# Altium schematic sheet PiggySat-radio.SchDoc: PiggySat-radio
size A4; DocumentNumber: 002; Revision: 1.0; SheetNumber: 1; SheetTotal: 2
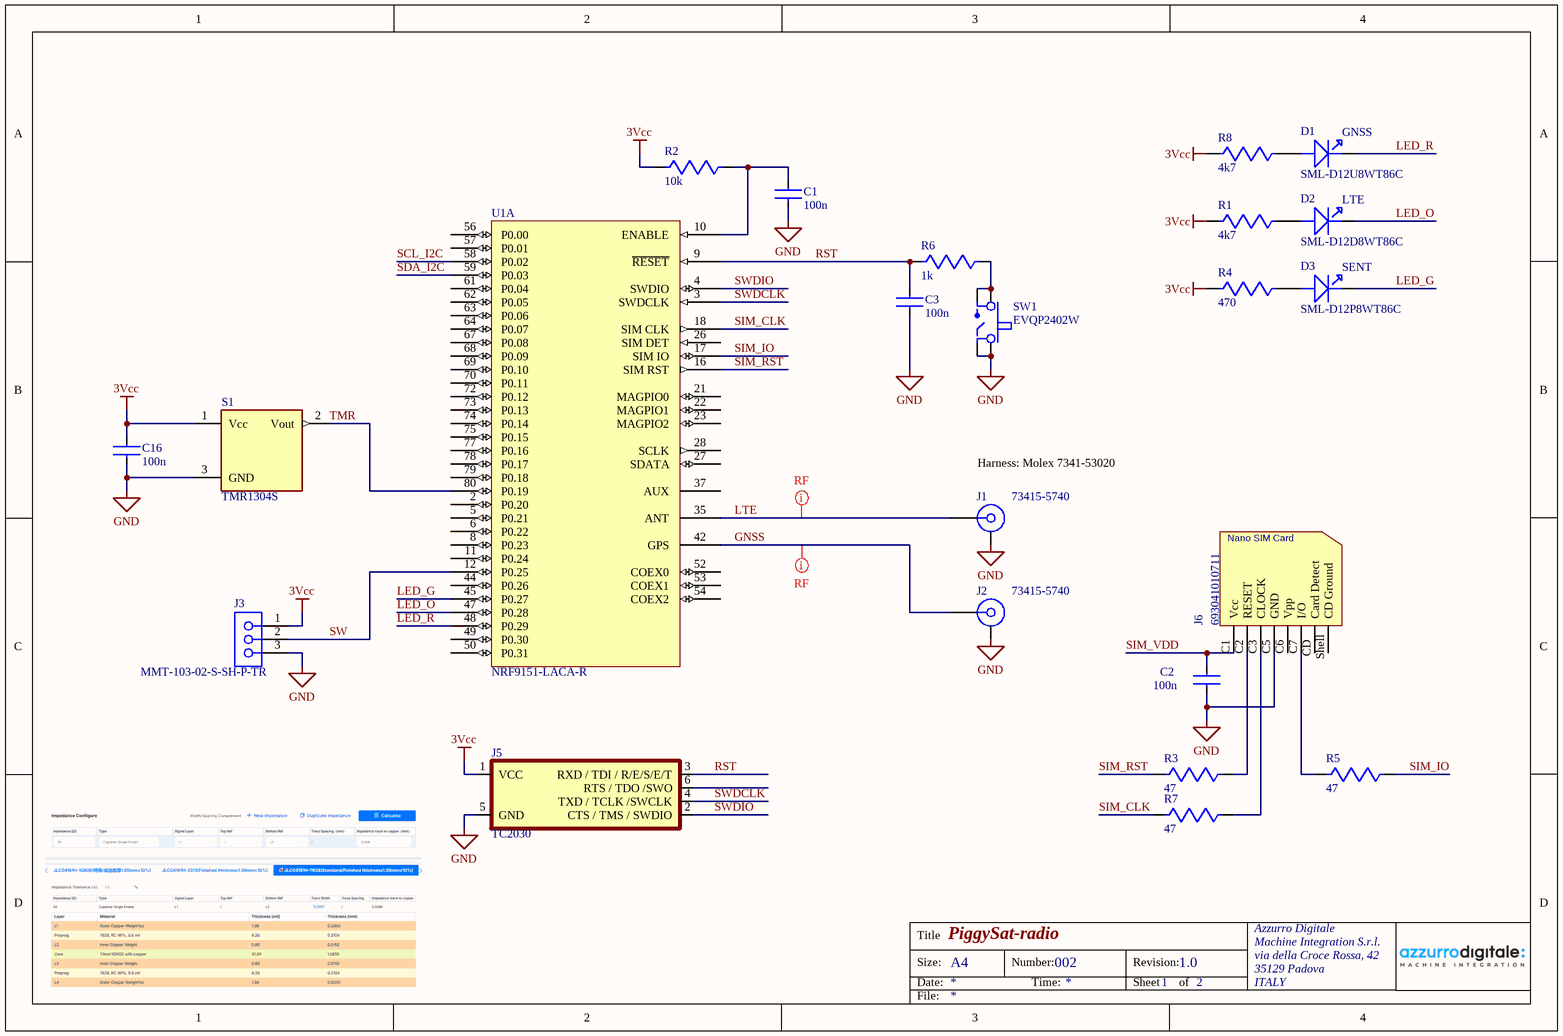
[diagram p0: PiggySat-radio.SchDoc]

## Parts
C1  100n  [CAPC1608X06L]
C2  100n  [CAPC1608X06L]
C3  100n  [CAPC1608X06L]
C16  100n  [CAPC1608X06L]
D1  SML-D12U8WT86C  [SML-D12]
D2  SML-D12D8WT86C  [SML-D12]
D3  SML-D12P8WT86C  [SML-D12]
J1  73415-5740  [MOLEX_734155740]
J2  73415-5740  [MOLEX_734155740]
J3  MMT-103-02-S-SH-P-TR  [MMT-103-01-SM-SH-TR]
J5  TC2030  [TC2030-IDC]  (no BOM)
J6  693041010711  [693041010711]
R1  4k7  [RESC1005X04L]
R2  10k  [RESC1005X04L]
R3  47  [RESC1005X04L]
R4  470  [RESC1005X04L]
R5  47  [RESC1005X04L]
R6  1k  [RESC1005X04L]
R7  47  [RESC1005X04L]
R8  4k7  [RESC1005X04L]
S1  TMR1304S  [SOT-23-3]
SW1  EVQP2402W  [EVQP2402W]
U1  NRF9151-LACA-R  [FP-nRF9151-LACA-R_MFG]  (part A of 2)

## Nets
3Vcc: C16.1 J3.1 J5.1(VCC) R1.1 R2.1 R4.1 R8.1 S1.1(Vcc)
GND: C1.2 C2.1 C3.1 C16.2 J1.2 J2.2 J3.3 J5.5(GND) J6.C5(GND) S1.3(GND) SW1.1 SW1.3
GNSS: J2.1 U1.42(GPS)
LED_G: D3.2 U1.45(P0.27)
LED_O: D2.2 U1.47(P0.28)
LED_R: D1.2 U1.48(P0.29)
LTE: J1.1 U1.35(ANT)
RST: C3.2 J5.3(RXD_/_TDI_/_R/E/S/E/T) R6.2 U1.9(~{RESET})
SCL_I2C: U1.58(P0.02)
SDA_I2C: U1.59(P0.03)
SIM_CLK: R7.1 U1.18(SIM_CLK)
SIM_IO: R5.2 U1.17(SIM_IO)
SIM_RST: R3.1 U1.16(SIM_RST)
SIM_VDD: C2.2 J6.C1(Vcc)
SW: J3.2 U1.12(P0.25)
SWDCLK: J5.4(TXD_/_TCLK_/SWCLK) U1.3(SWDCLK)
SWDIO: J5.2(CTS_/_TMS_/_SWDIO) U1.4(SWDIO)
TMR: S1.2(Vout) U1.80(P0.19)
NetC1_1: C1.1 R2.2 U1.10(ENABLE)
NetD1_1: D1.1 R8.2
NetD2_1: D2.1 R1.2
NetD3_1: D3.1 R4.2
NetJ6_C2: J6.C2(RESET) R3.2
NetJ6_C3: J6.C3(CLOCK) R7.2
NetJ6_C7: J6.C7(I/O) R5.1
NetR6_1: R6.1 SW1.2 SW1.4

Not connected (* = marked no-connect by the designer): J5 6(RTS_/_TDO_/SWO); J6 C6(Vpp) CD(Card_Detect) Shell(CD_Ground); U1 2(P0.20) 5(P0.21) 6(P0.22) 8(P0.23) 11(P0.24) 21(MAGPIO0) 22(MAGPIO1) 23(MAGPIO2) 26(SIM_DET) 27(SDATA) 28(SCLK) 37(AUX) 44(P0.26) 49(P0.30) 50(P0.31) 52(COEX0) 53(COEX1) 54(COEX2) 56(P0.00) 57(P0.01) 61(P0.04) 62(P0.05) 63(P0.06) 64(P0.07) 67(P0.08) 68(P0.09) 69(P0.10) 70(P0.11) 72(P0.12) 73(P0.13) 74(P0.14) 75(P0.15) 77(P0.16) 78(P0.17) 79(P0.18)

## Layout directives
net class RF: GNSS, LTE

## Notes on the sheet
- (near D1) GNSS
- (near D2) LTE
- (near D3) SENT
- (near J1) Harness: Molex 7341-53020
- Title
- Size:
- Date:
- A4
- Number:
- Time:
- Revision:
- Sheet
- of
- Azzurro Digitale
- Machine Integration S.r.l.
- via della Croce Rossa, 42
- 35129 Padova
- ITALY
- File:
- (in symbol CMP-03913-167535528-1) Nano SIM Card

## Library data of the parts
C1-C3 C16 = CMP-001-00001-3: Cap 16V 100n X7R 0603 10%; Component Class: Capacitors
D1 = CMP-007-000019-1: LED, 0603, Red, SMD, 0,8mm x 1,6mm, 20 mA, 2.2 V, 620 nm; Cod. Alt.: (); Comment1: LED0805; Cod. Mag.: LV-SMD-0805; Design Item ID: SML-D12U8WT86C; Montaggio: (); Cod. Fornitore: (); Prezzo: (); Source: Altium_Library.SchLib; Fornitore: ()
D2 = CMP-007-000019-1: LED, 0603, Orange, SMD, 0,8mm x 1,6mm, 20 mA, 2.2 V, 620 nm; Cod. Alt.: (); Comment1: LED0805; Cod. Mag.: LV-SMD-0805; Design Item ID: SML-D12D8WT86C; Montaggio: (); Cod. Fornitore: (); Prezzo: (); Source: Altium_Library.SchLib; Fornitore: ()
D3 = CMP-007-000018-1: LED, 0603, Green, SMD, 0,8mm x 1,6mm, 20 mA, 2.2 V, 560 nm; Cod. Fornitore: (); Comment1: LED0805; Cod. Mag.: LV-SMD-0805; Fornitore: (); Montaggio: (); Design Item ID: SML-D12P8WT86C; Prezzo: (); Source: Altium_Library.SchLib; Cod. Alt.: ()
J1 J2 = 73415-5740: SMP PLUG, PCB EDGE MNT, SMOOTH B; Manufacturer: MOLEX; System: Connector; ComponentLink5Description: Webshop / RFQ; ComponentLink5URL: http://www.rosenberger.com/en/contact/sales/; ComponentLink3URL: http://rosenberger.de/ok/images/documents/db/32K145-400L5.pdf; ComponentLink2URL: http://rosenberger.de/ok/images/documents/db/32K145-400L5.pdf; ComponentLink4Description: Series Overview / Design Note; ComponentLink1Description: Manufacturer URL; ComponentLink2Description: Datasheet; ComponentLink3Description: Package Specification; ComponentLink1URL: http://www.rosenberger.de; ComponentLink4URL: http://rosenberger.de/ok/images/documents/spez/32.pdf; Mounting Technology: Surface Mount
J3 = MMT-103-01-SM-SH-TR: MMT Series 2.00 mm Horizontal Surface Mount Terminal Strip; System: Connector
J5 = CMP-002-000000-4: Serial cable 6-pin “Legged” Tag-Connector.
J6 = CMP-03913-167535528-1: WR-CRD SIM Card Connectors /
R1 R8 = CMP-009-00001-2: Res 4.7k 0402
R2 = CMP-009-00001-2: Res 10k 0402
R3 R5 R7 = CMP-009-00001-2: Res 47 0402
R4 = CMP-009-00001-2: Res 470 0402
R6 = CMP-009-00001-2: Res 1k 0402
S1 = CMP-00000-2: TMR130x is an omnipolar magnetic switch integrated the tunnel magnetoresistance (TMR) magnetic sensor and CMOS circuitry
SW1 = CMP-017-000001-1: Light Touch Switches/EVQP2/P9/3P2; Design Item ID: EVQP2402W; Source: Altium_Library.SchLib
U1 = CMP-00045-6: Lower Power SIP for cellular IoT and DECT NR+, Compatible with nRF Cloud Services; Number of ADC Channels: 8; Interface: 2-Wire, I2C, I2S, SPI, UART, USB; Max Supply Voltage: 5.5V; Number of GPIO: 32; Data Rate: 3.4Mbps; Bandwidth: 1.5GHz; Min Supply Voltage: 1.7V; Clock Frequency: 2.2GHz; Min Operating Temperature: -40°C; Height: 1.3mm; Max Operating Temperature: 85°C; RoHS: Compliant; Ambient Temperature Range High: 85°C